# Altium project Weather_Data.PrjPcb (part 2 of 2)

## Sheet Maitinimas board B.SchDoc
size A3; SheetNumber: 3; SheetTotal: 6
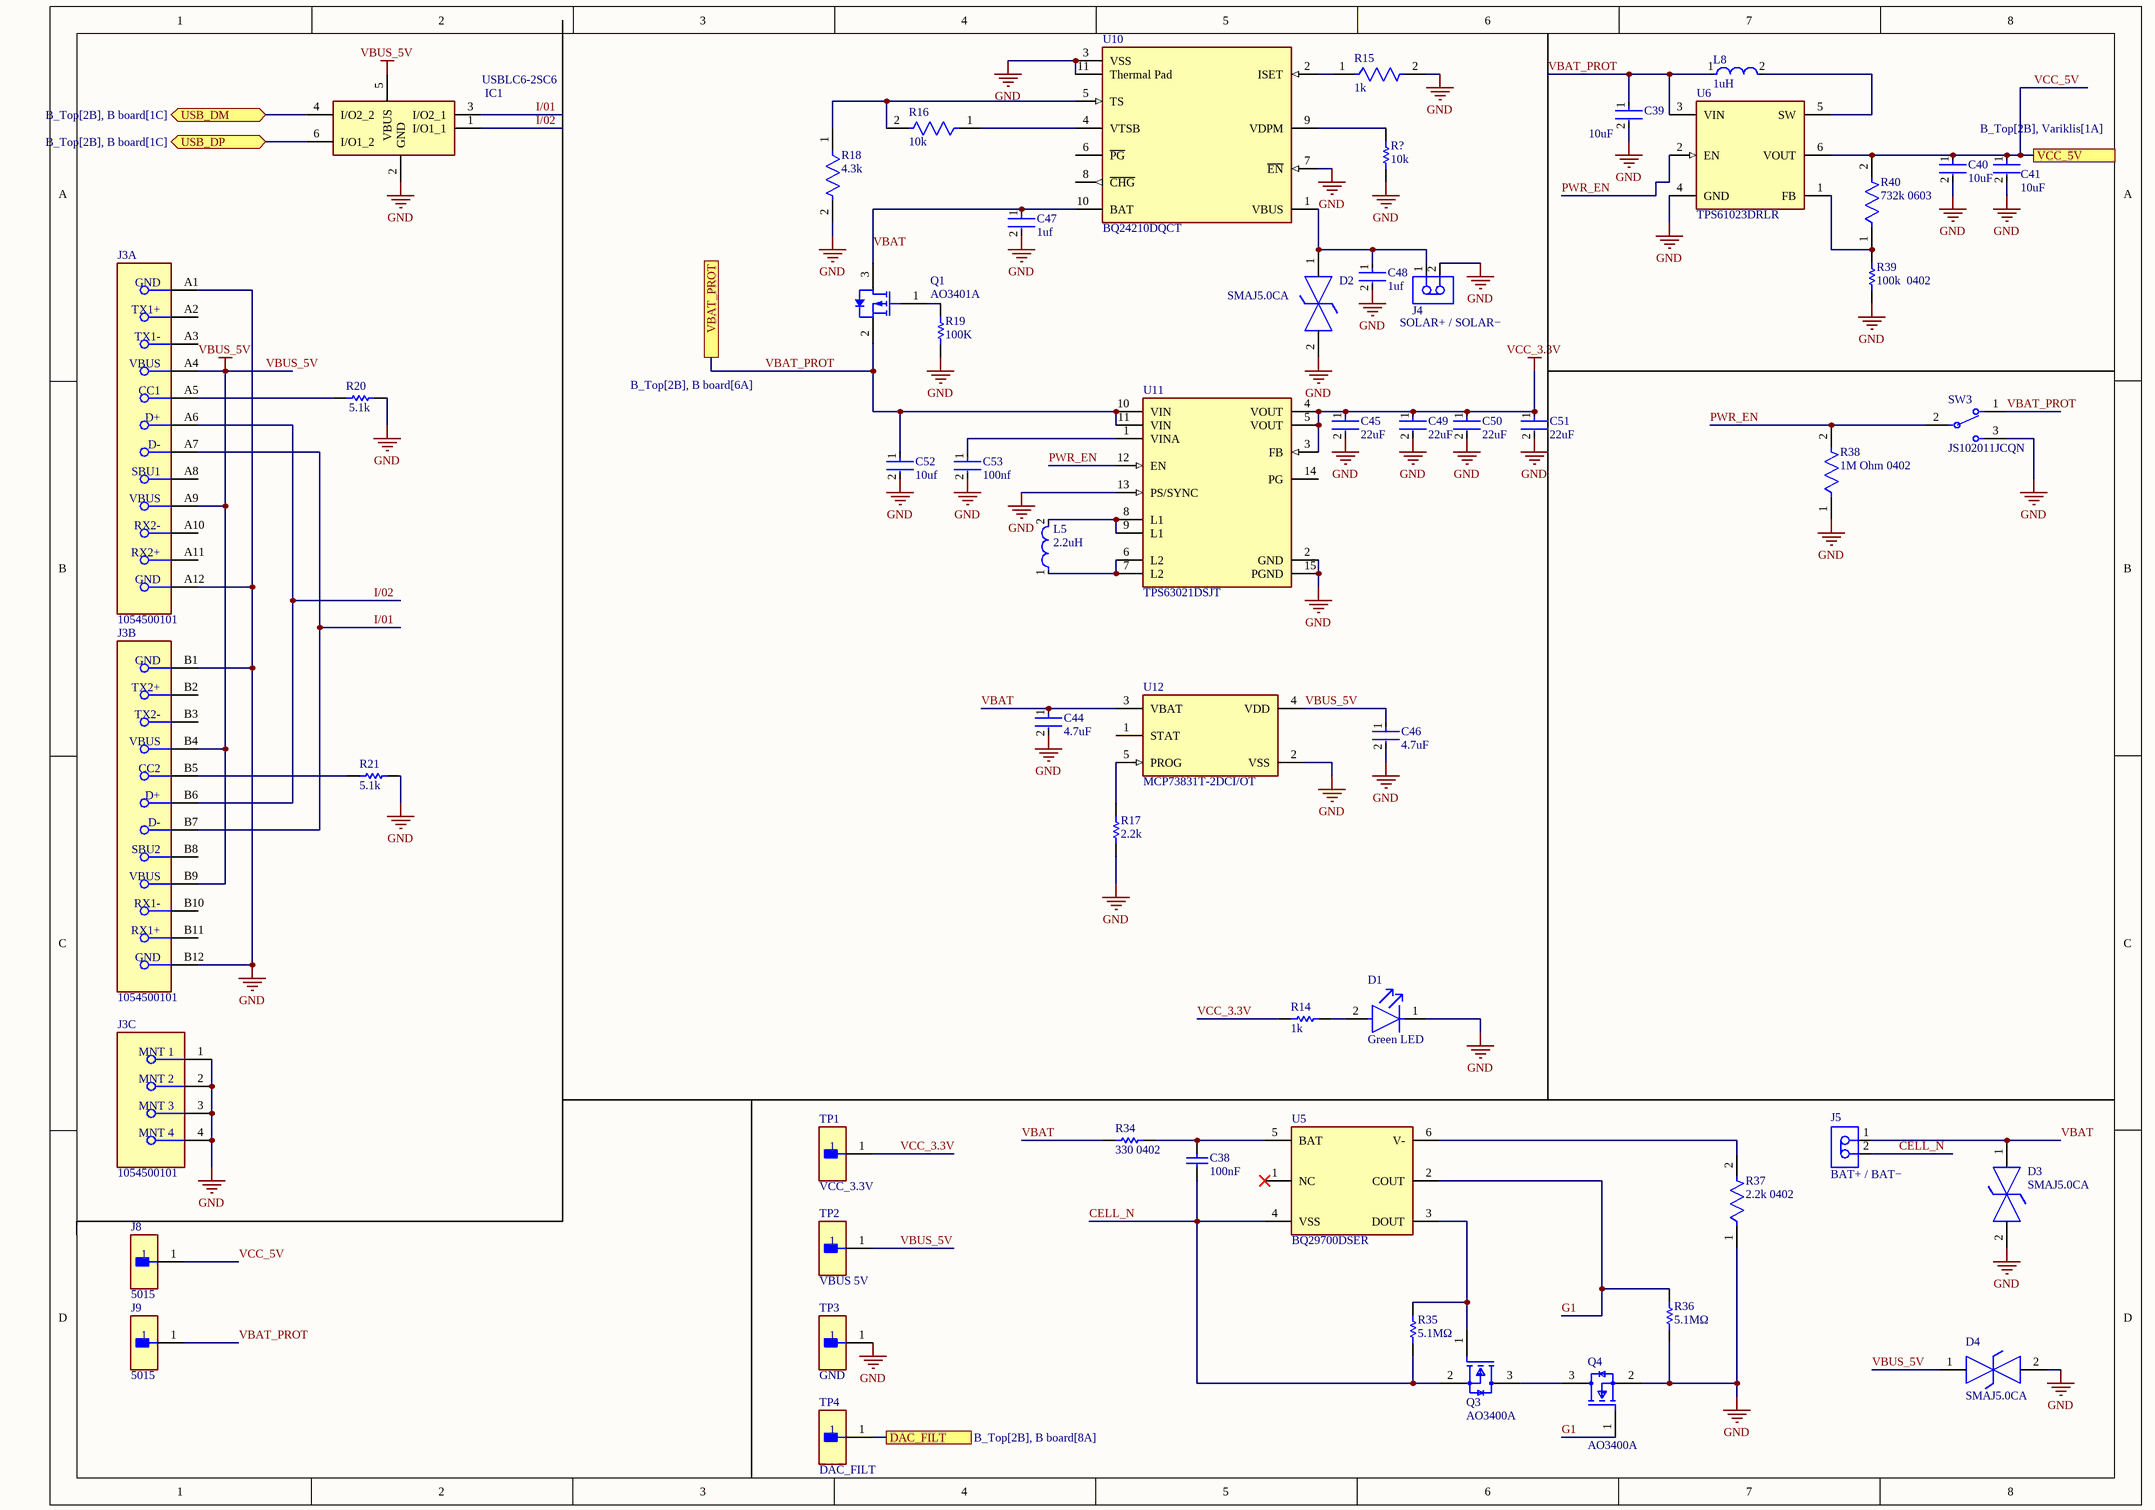
[diagram p2: Maitinimas board B.SchDoc]

### Parts
C38  100nF  [CAPC1608X90X35NL15T15]
C39  10uF  [FP-GRM21B-0_2-e0_2_0_7-IPC_A]
C40  10uF  [FP-GRM21B-0_15-IPC_C]
C41  10uF  [FP-GRM21B-0_15-IPC_C]
C44  4.7uF  [FP-CL21-IPC_A]
C45  22uF  [FP-GRM21B-0_15-IPC_C]
C46  4.7uF  [FP-CL21-IPC_A]
C47  1uf  [FP-CL858-IPC_C]
C48  1uf  [FP-CL858-IPC_C]
C49  22uF  [FP-GRM21B-0_15-IPC_C]
C50  22uF  [FP-GRM21B-0_15-IPC_C]
C51  22uF  [FP-GRM21B-0_15-IPC_C]
C52  10uf  [FP-CL05A106MP5NUNC-MFG]
C53  100nf  [FP-0402B104K500CT-IPC_C]
D1  Green LED  [FP-LTST-C171GKT-MFG]
D2  SMAJ5.0CA  [FP-SMAJ-MFG]
D3  SMAJ5.0CA  [FP-SMAJ-MFG]
D4  SMAJ5.0CA  [FP-SMAJ-MFG]
IC1  USBLC6-2SC6  [SOT95P280X145-6N]
J3  1054500101  [FP-1054500101-MFG]  (parts A,B,C of 3)
J4  SOLAR+ / SOLAR−  [JST-B2B-PH-K-S_V]
J5  BAT+ / BAT−  [JST-B2B-PH-K-S_V]
J8  5015  [FP-5015-MFG]
J9  5015  [FP-5015-MFG]
L5  2.2uH  [FP-MLP2016M-MFG]
L8  1uH  [FP-DFE252012C-IPC_B]
Q1  AO3401A  [AO-SOT-23-3L_V]
Q3  AO3400A  [FP-SOT23-MFG]
Q4  AO3400A  [FP-SOT23-MFG]
R14  1k  [RESC1005X40X25ML10T10]
R15  1k  [FP-TFCR0805-MFG]
R16  10k  [FP-AC0603-IPC_A]
R17  2.2k  [RESC1005X40X25NL10T10]
R18  4.3k  [FP-RN73R1E-MFG]
R19  100K  [RESC1812(4532)_L]
R20  5.1k  [RESC1005X40X25ML10T10]
R21  5.1k  [RESC1005X40X25ML10T10]
R34  330 0402  [RESC1005X40X25NL10T10]
R35  5.1MΩ  [RESC1005X40X25ML05T05]
R36  5.1MΩ  [RESC1005X40X25ML05T05]
R37  2.2k 0402  [FP-ESR01-IPC_B]
R38  1M Ohm 0402  [FP-CRGCQ0402-IPC_C]
R39  100k  0402  [RESC1005X40X25NL05T10]
R40  732k 0603  [FP-CRCW0603-e3-IPC_B]
R?  10k  [RESC3225X60X45NL20T20]
SW3  JS102011JCQN  [FP-JS102011JCQN-MFG]
TP1  VCC_3.3V  [FP-5015-MFG]
TP2  VBUS 5V  [FP-5015-MFG]
TP3  GND  [FP-5015-MFG]
TP4  DAC_FILT  [FP-5015-MFG]
U5  BQ29700DSER  [FP-DSE0006A-IPC_B]
U6  TPS61023DRLR  [FP-DRL0006A-MFG]
U10  BQ24210DQCT  [FP-DQC0010A-MFG]
U11  TPS63021DSJT  [FP-DSJ0014A-MFG]
U12  MCP73831T-2DCI/OT  [FP-C04-091-OT-IPC_B]

### Ports
DAC_FILT (see B_Top[2B], B board[8A]), USB_DM (bidir, see B_Top[2B], B board[1C]), USB_DP (bidir, see B_Top[2B], B board[1C]), VBAT_PROT (see B_Top[2B], B board[6A]), VCC_5V (see B_Top[2B], Variklis[1A])

### Nets
GND: C39.2 C40.2 C41.2 C44.2 C45.2 C46.2 C47.2 C48.2 C49.2 C50.2 C51.2 C52.2 C53.2 D1.1(C) D2.2 D3.2 D4.2 IC1.2(GND) J3.1(MNT_1) J3.2(MNT_2) J3.3(MNT_3) J3.4(MNT_4) J3.A1(GND) J3.A12(GND) J3.B1(GND) J3.B12(GND) J4.2 Q4.2(S) R15.2 R17.1 R18.2 R19.2 R20.2 R21.2 R36.1 R37.1 R38.1 R39.1 R?.1 SW3.3 TP3.1 U6.4(GND) U10.3(VSS) U10.7(~{EN}) U10.11(Thermal_Pad) U11.2(GND) U11.13(PS/SYNC) U11.15(PGND) U12.2(VSS)
VBUS_5V: C46.1 D4.1 IC1.5(VBUS) J3.A4(VBUS) J3.A9(VBUS) J3.B4(VBUS) J3.B9(VBUS) TP2.1 U12.4(VDD)
VCC_3.3V: C45.1 C49.1 C50.1 C51.1 R14.1 TP1.1 U11.3(FB) U11.4(VOUT) U11.5(VOUT)
CELL_N: C38.1 J5.2 Q3.2(S) R35.1 U5.4(VSS)
G1: Q4.1(G) R36.2 U5.2(COUT)
I/01: IC1.3(I/O2_1) J3.A7(D-) J3.B7(D-)
I/02: IC1.1(I/O1_1) J3.A6(D+) J3.B6(D+)
PWR_EN: R38.2 SW3.2 U6.2(EN) U11.12(EN)
VBAT: C44.1 C47.1 D3.1 J5.1 Q1.3(DRAIN) R34.1 U10.10(BAT) U12.3(VBAT)
VBAT_PROT: C39.1 C52.1 J9.1 L8.1 Q1.2(SOURCE) SW3.1 U6.3(VIN) U11.10(VIN) U11.11(VIN) ; port VBAT_PROT
VCC_5V: C40.1 C41.1 J8.1 R40.2 U6.6(VOUT) ; port VCC_5V
NetC17_2: TP4.1 ; port DAC_FILT
NetC38_2: C38.2 R34.2 U5.5(BAT)
NetC48_1: C48.1 D2.1 J4.1 U10.1(VBUS)
NetC53_1: C53.1 U11.1(VINA)
NetD1_2: D1.2(A) R14.2
NetIC1_4: IC1.4(I/O2_2) ; port USB_DM
NetIC1_6: IC1.6(I/O1_2) ; port USB_DP
NetJ3_A5: J3.A5(CC1) R20.1
NetJ3_B5: J3.B5(CC2) R21.1
NetL5_1: L5.1 U11.6(L2) U11.7(L2)
NetL5_2: L5.2 U11.8(L1) U11.9(L1)
NetL8_2: L8.2 U6.5(SW)
NetQ1_1: Q1.1(GATE) R19.1
NetQ3_1: Q3.1(G) R35.2 U5.3(DOUT)
NetQ3_3: Q3.3(D) Q4.3(D)
NetR15_1: R15.1 U10.2(ISET)
NetR16_1: R16.1 U10.4(VTSB)
NetR16_2: R16.2 R18.1 U10.5(TS)
NetR17_2: R17.2 U12.5(PROG)
NetR37_2: R37.2 U5.6(V-)
NetR39_2: R39.2 R40.1 U6.1(FB)
NetR?_2: R?.2 U10.9(VDPM)

Not connected (* = marked no-connect by the designer): J3 A2(TX1+) A3(TX1-) A8(SBU1) A10(RX2-) A11(RX2+) B2(TX2+) B3(TX2-) B8(SBU2) B10(RX1-) B11(RX1+); U5 1(NC)*; U10 6(~{PG}) 8(~{CHG}); U11 14(PG); U12 1(STAT)

### Library data of the parts
C38 = CMP-2006-02299-1: Part Number: C0603C104K4RAC7013; Manufacturer: Kemet
C39 = CMP-06035-026322-1: Chip Multilayer Ceramic Capacitors for General Purpose, 0805, 22uF, X5R, 15%, 20%, 16V; Height: 1.25mm; Thickness: 0.057inch; Min Operating Temperature: -55°C; Tolerance: 20%; Package Quantity: 3000; Packaging: Tape and Reel; Capacitance: 22uF; Case/Package: 0805; Voltage Rating: 16V; Dielectric: X5R; Max Operating Temperature: 85°C; Case Code (Metric): 2012; Depth: 1.25mm; Lead Free: Lead Free; Termination: SMD/SMT; Case Code (Imperial): 0805; Voltage Rating (DC): 16V; Length: 2mm; Weight: 0.000335oz; Width: 0.049inch; Mount: Surface Mount
C40 C41 = CMP-2007-03541-2: Chip Multilayer Ceramic Capacitors for General Purpose, 0805, 10uF, X5R, 15%, 10%, 25V; Length: 2mm; Depth: 1.25mm; Termination: SMD/SMT; Voltage: 25V; Height: 1.25mm; Material: Ceramic; Thickness: 0.053inch; Radiation Hardening: No; Min Operating Temperature: -55°C; Width: 0.049inch; Package Quantity: 1; Mount: Surface Mount; Dielectric: X5R; Packaging: Tape and Reel; Capacitance: 10uF; Voltage Rating (DC): 25V; Lead Free: Lead Free; Max Operating Temperature: 85°C; Case Code (Imperial): 0805; Case/Package: 0805; Tolerance: 10%; Voltage Rating: 25V; Case Code (Metric): 2012
C44 C46 = CMP-13271-002624-1: CL21 Series 0805 4.7uF 25V ±10% Tolerance X5R Multilayer Ceramic Chip Capacitor; Case Code (Imperial): 0805; Thickness: 0.055inch; Mount: Surface Mount; Case Code (Metric): 2012; Capacitance: 4.7uF; Depth: 1.25mm; Lead Free: Lead Free; Case/Package: 0805; Voltage Rating: 25V; Package Quantity: 1; Width: 0.049inch; Radiation Hardening: No; Voltage Rating (DC): 25V; Length: 2mm; Dielectric: X5R; Height: 1.25mm; Packaging: Tape and Reel; Tolerance: 10%; Min Operating Temperature: -55°C; Max Operating Temperature: 85°C
C45 C49-C51 = CMP-06035-052350-1: Chip Multilayer Ceramic Capacitors for General Purpose, 0805, 22uF, X5R, 15%, 20%, 10V; Tolerance: 20%; Capacitance: 22uF; Dielectric: X5R; Width: 1.25mm; Voltage Rating (DC): 10V; Length: 2mm; Thickness: 1.25mm; Case/Package: 0805
C47 C48 = CMP-13271-003231-1: Cap Ceramic 1uF 6.3V X6S ±10% SMD 0402 +105°C Paper T/R; Mount: Surface Mount; Voltage Rating: 6.3V; Min Operating Temperature: -55°C; Case/Package: 0402; Thickness: 0.022inch; Radiation Hardening: No; Capacitance: 1uF; Contact Plating: Tin; Max Operating Temperature: 105°C; Length: 1mm; Tolerance: 10%; Dielectric: X6S; Height: 0.5mm; Depth: 0.5mm; Case Code (Imperial): 0402; Package Quantity: 1; Width: 0.02inch; Case Code (Metric): 1005; Packaging: Tape and Reel
C52 = CMP-13271-000002-1: CAP CER 10UF 10V X5R 0402; Manufacturer Part Number: CL05A106MP5NUNC; Manufacturer: Samsung; Temperature Coefficient: 15%; Tolerance: 20%; Material: Ceramic; Octopart: https://octopart.com/cl05a106mp5nunc-samsung-22457395; Voltage Rating: 10V; RoHS: TRUE; Value: 10uF; Height: 0.7mm; Digikey Description: CAP CER 10UF 10V X5R 0402; Automotive: No; Package: CL05A106MP5NUNC; Device Class L1: Passive Components; Capacitance: 10uF; Temperature Range High: +85°C; ComponentLink2Description: Datasheet; Device Class L2: Capacitors; Temperature Characteristic: X5R; Temperature: -55°C to +85°C; ComponentLink2URL: http://www.samsungsem.com/kr/support/product-search/mlcc/__icsFiles/afieldfile/2019/05/10/19-CL05A106MP5NUNC.pdf; Device Class L3: Ceramic Capacitors; Category: Cap; Temperature Range Low: -55°C; Ipc Land Pattern Name: CAPC10050X50; Lead Free: Yes
C53 = CMP-45632-000010-1: CAP CER 0.1UF 50V X7R 0402; Tolerance: 10%; Max Operating Temperature: 125°C; Case Code (Metric): 1005; RoHS Compliant: Yes; Series: -; Case Code (Imperial): 0402; Voltage Rating: 50V; Min Operating Temperature: -55°C; Mount: Surface Mount; Capacitance: 100nF; Case/Package: 0402; Packaging: Cut Tape
D1 = CMP-22017-000007-1: LED GREEN CLEAR CHIP SMD; Luminous Intensity: 12mcd; Lens Color: Colorless; Dominant Wavelength: 569nm; Number of LEDs: 1; Power Dissipation: 100mW; Viewing Angle: 130°; Reverse Voltage: 5V; Test Current: 10mA; Forward Voltage: 2.1V; Wavelength: 585nm; Lens Style: Diffused; Forward Current: 30mA; Height: 0.8mm; Mount: Surface Mount; Package Quantity: 1; Length: 2mm; Case Code (Metric): 2012; Number of Pins: 2; Number of Elements: 1; Packaging: Tape and Reel; Color: Green; Min Operating Temperature: -55°C; Case/Package: 0805; Power Rating: 100mW; Max Operating Temperature: 85°C; Radiation Hardening: No; Depth: 1.25mm; Lens Transparency: Clear; Width: 1.25mm; Lead Free: Lead Free; Case Code (Imperial): 0805; Illumination Color: Green
D2-D4 = CMP-2000-07091-2: TVS DIODE 5V 9.2V SMA; Manufacturer: Bourns Inc.; Direction: Bidirectional; Standoff Height: 0.05mm; Breakdown Voltage: 6.4V; Number Of Channels: 1; Max Junction Temp: +150°C; Peak Pulse Power: 400W; Lead Free: Yes; Digikey Description: TVS DIODE 5V 9.2V SMA; Automotive: No; Temperature: -55°C to +150°C; Package: SMAJ; Temperature Range Low: -55°C; Octopart: https://octopart.com/smaj5.0ca-bourns-12809390; Device Class L2: TVS Diodes; Device Class L3: unset; ComponentLink2URL: https://bourns.com/data/global/pdfs/SMAJ.pdf; RoHS: TRUE; ComponentLink2Description: Datasheet; Mouser Description: TVS Diodes - Transient Voltage Suppressors 5volts 800/1600uA 43.5 Amps Bi-Dir; Reverse Standoff Voltage: 5V; Temperature Range High: +150°C; Height: 2.62mm; Manufacturer Part Number: SMAJ5.0CA; Category: Diode; Device Class L1: Circuit Protection
IC1 = USBLC6-2SC6: Integrated Circuit; Manufacturer_Name: STMicroelectronics; Datasheet Link: https://www.st.com/resource/en/datasheet/usblc6-2.pdf; Height: 1.45mm; Manufacturer_Part_Number: USBLC6-2SC6; Mouser Part Number: 511-USBLC6-2SC6; Mouser Price/Stock: https://www.mouser.co.uk/ProductDetail/STMicroelectronics/USBLC6-2SC6?qs=po45yt2pPpu%2FhNIlwQdTlg%3D%3D; Arrow Part Number: USBLC6-2SC6; Arrow Price/Stock: https://www.arrow.com/en/products/usblc6-2sc6/stmicroelectronics.html?utm_currency=USD&region=asia
J3 = CMP-04767-000004-1: CONN RCP USB3.1 TYPEC 24P SMD RA; Manufacturer: Molex; Number Of Contacts: 24; Voltage Rating: 30V; Shielding: true; Is Female: yes; Current Rating: 0.25/1.25/5A; Pitch: 0.5mm; Conn Orientation: Right Angle; Package: 0; Height: 3.44mm; Footprint Url: https://www.molex.com/pdm_docs/sd/1054500101_sd.pdf; Device Class L1: Connectors; Category: Conn; Device Class L2: USB Connectors; Digikey Description: CONN RCP USB3.1 TYPEC 24P SMD RA; Contact Material: Gold,Nickel; Mouser Description: USB Shielded I/O Receptacle; Type C; Right Angle; Surface Mount; Gold over Nickel; ComponentLink2Description: Datasheet; Lead Free: Yes; Automotive: No; Temperature Range High: +85°C; RoHS: TRUE; Octopart: https://octopart.com/105450-0101-molex-68082325; ComponentLink2URL: https://www.molex.com/webdocs/datasheets/pdf/en-us/1054500101_IO_CONNECTORS.pdf; Temperature: -30°C to +85°C; Usb Standard: USB 3.1; Temperature Range Low: -30°C; Device Class L3: unset; Manufacturer Part Number: 1054500101
J4 J5 = CMP-2000-05162-1: Male Header, Pitch 2 mm, 1 x 2 Position, Height 6 mm, Tail Length 3.4 mm, -25 to 85 degC, RoHS, Bulk; Manufacturer: JST; Pitch: 2mm; Style/Orientation: StraightHeader/Plug; No of Positions: 2; Datasheet Version: Nov-08; Datasheet URL: http://datasheet.octopart.com/B2B-PH-K-S%28LF%29%28SN%29-JST-datasheet-8324864.pdf; Manufacturer URL: http://www.jst.com/home2.html; Type: ShroudedHeader; Termination: Crimp
J8 J9 = CMP-2000-05183-2: PC TEST POINT MINIATURE; Manufacturer: keystone; Number Of Contacts: 1; Conn Orientation: Straight; Category: Conn; Manufacturer Part Number: 5015; Digikey Description: PC TEST POINT MINIATURE; Automotive: No; Lead Free: Yes; Octopart: https://octopart.com/5015-keystone-3822; ComponentLink2URL: http://www.keyelco.com/product-pdf.cfm?p=1353; Package: 5015; RoHS: TRUE; Device Class L3: unset; Device Class L2: unset; Contact Material: Silver; Device Class L1: Connectors; Height: 1.65mm; ComponentLink2Description: Datasheet
L5 = CMP-08253-000274-1: Shielded Multilayer Inductor 2.2uH ±20% 1200mA 137.5mΩ SMD 0806; DC Resistance (DCR): 137.5mR; Current Rating: 1.2A; Test Frequency: 2MHz; Core Material: Ferrite; Shielding: Unshielded; Mount: Surface Mount; Max Operating Temperature: 125°C; Packaging: Tape and Reel; Lead Free: Lead Free; Height - Seated (Max): 0.039inch; Length: 0.079inch; Case/Package: 0806; Case Code (Metric): 2016; Case Code (Imperial): 0806; Inductance: 2.2uH; RoHS Compliant: Yes; Width: 0.063inch; Package Quantity: 3000; Tolerance: 20%; Min Operating Temperature: -40°C
L8 = CMP-06042-006150-1: Shielded Wirewound Inductor 1uH 20% 3200mA 0.042Ω 1008 (2520); Core Material: Ferrite; Current Rating: 4.3A; Test Frequency: 1MHz; DC Resistance (DCR): 42mR; Max DC Current: 3.2A; Tolerance: 20%; Resistor Type: Wirewound; Inductance: 1uH; Length: 0.098inch; Min Operating Temperature: -40°C; Case Code (Imperial): 1008; Mount: Surface Mount; Depth: 2mm; Height - Seated (Max): 0.039inch; Max Operating Temperature: 125°C; Width: 0.079inch; Case/Package: 1008; Packaging: Tape and Reel; Case Code (Metric): 2520; Shielding: Shielded
Q1 = CMP-2000-05778-1: P-Channel MOSFET, 30 V, 4 A, -55 to 150 degC, 3-Pin SOT-23-3L, RoHS, Tape and Reel; Manufacturer: Alpha and Omega; Output Power (Max): NotRequiredW; Power Dissipation: 1.4W; Rad Hardened: No; Drain Efficiency: NotRequired%; Drain-Source On-Volt: 30V; Noise Figure: NotRequireddB; Frequency (Max): NotRequiredMHz; Number of  Elements: 1; Gate-Source Voltage (Max): ?12V; Drain Current (Max): 4A; Channel Mode: Enhancement; Drain-Source On-Res: 0.044ohm; Type: PowerMOSFET; Polarity: P; Package URL: http://www.aosmd.com/res/packaging_information/SOT-23-3L.pdf; Datasheet URL: http://www.aosmd.com/res/data_sheets/AO3401A.pdf; Package Type: SOT-23; Package Description: 3-Pin Small Outline Transistor, Body 2.95 x 1.6 mm, Pitch 0.95 mm; Mounting: SurfaceMount; Manufacturer URL: http://www.aosmd.com/; Continuous Drain Current: 4A; Package Reference: SOT-23-3L; Mounting Technology: SurfaceMount; Operating Temperature Classification: Military; Power Gain: NotRequireddB; Datasheet Version: Rev. 3, 03/2011; Operating Temp Range: -55Cto150C; Pin Count: 3
Q3 Q4 = CMP-83955-000006-1: MOSFET N-CH 30V 5.7A SOT23; Input Capacitance: 630pF; Number of Elements: 1; Rds On Max: 26.5mR; Max Power Dissipation: 1.4W; Gate to Source Voltage (Vgs): 12V; Min Operating Temperature: -55°C; Lead Free: Lead Free; Number of Pins: 3; Drain to Source Voltage (Vdss): 30V; Case/Package: SOT-23; Mount: Surface Mount; Continuous Drain Current (ID): 5.7A; Radiation Hardening: No; Packaging: Tape and Reel; Max Operating Temperature: 150°C; Power Dissipation: 1.4W
R14 = CMP-2002-04581-1: Manufacturer: KOA Speer; Part Number: SG73P1ETTP1001F
R15 = CMP-250906-230108-1: RES Thin Film,  620Ω, 0.1%, 0.125W, 50ppm/°C, 0805
R16 = CMP-03412-040683-1: RES 10kΩ 5.00% 0.2W 0603
R17 = CMP-2002-03812-1: Manufacturer: KOA Speer; Part Number: RK73H1ETTP2201F
R18 = CMP-04015-046329-1: 4.3kΩ ±1% 0.063W, 1/16W Chip Resistor 0402 (1005 Metric) Moisture Resistant Thin Film
R19 = CMP-1016-00715-1: 100K 0.75W 1% 1812 (4532 Metric)  SMD; Case-EIA: 1812; Value: 100000.00 Ohm; Case-Metric: 4532; Technology: SMT; Power: 0.75 W; Tolerance: 1 %
R20 R21 = CMP-2002-04046-1: Manufacturer: KOA Speer; Part Number: RK73H1ETTP5101F
R34 = CMP-1011-00454-2: Part Number: CR0402-FX-3300GLF; Manufacturer: Bourns
R35 R36 = CMP-1011-00163-2: Part Number: ERJ-2GEJ515X; Manufacturer: Panasonic
R37 = CMP-08839-005908-1: 2.2kΩ ±1% 0.2W 0402 Anti-Surge Chip Resistor AEC-Q200; RoHS Compliant: Yes
R38 = CMP-03211-005885-1: Res Thick Film 0402 1M Ohm 1% 0.063W(1/16W) ±100ppm/C Pad SMD Automotive T/R; Manufacturer: TE Connectivity; Manufacturer Part Number: CRGCQ0402F1M0; Power Rating: 0.0625W; Tolerance: 0.01; Resistance: 1MΩ; Voltage Rating: 50V; Value: 1MΩ; Temperature Coefficient: ±100ppm/°C; Series: CRGCQ; Digikey Description: Res Thick Film 0402 1M Ohm 1% 0.063W(1/16W) ±100ppm/C Pad SMD Automotive T/R; Automotive: Yes; ComponentLink2URL: https://www.te.com/commerce/DocumentDelivery/DDEController?Action=showdoc&DocId=Data+Sheet%7F1773204-3%7F1%7Fpdf%7FEnglish%7FENG_DS_1773204-3_1.pdf%7F4-2176347-1378; Ipc Land Pattern Name: RESC10050X35; Category: Res; ComponentLink2Description: Datasheet; Temperature Range High: +155°C; Temperature Range Low: -55°C; Device Class L3: Chip SMD Resistors; RoHS: TRUE; Lead Free: Yes; Octopart: https://octopart.com/crgcq0402f1m0-te+connectivity-91017950; Ambient Temperature Range High: +70°C; Package: CRGCQ0402; Mouser Description: Res Thick Film 0402 1M Ohm 1% 0.063W(1/16W) ±100ppm/C Pad SMD Automotive T/R; Device Class L1: Passive Components; Temperature: -55°C to +155°C; Composition: Thick Film; Device Class L2: Resistors; Height: 0.4mm
R39 = CMP-2002-07343-1: Part Number: RC0402FR-07100KL; Manufacturer: Yageo / Phycomp
R40 = CMP-1012-00834-2: RES Thick Film, 732kΩ, 1%, 0.1W, 100ppm/°C, 0603; Power Rating: 100mW; Resistance: 732kR; Voltage Rating: 75V; Number of Terminations: 2; Temperature Coefficient: 100ppm/°C; Tolerance: 1%; Package Quantity: 10; Case/Package: 0603; Max Power Dissipation: 100mW; Features: Automotive AEC-Q200; Height: 0.02inch; Military Standard: Not; Contact Plating: Tin; Radiation Hardening: No; Case Code (Imperial): 0603; Depth: 0.85mm; Number of Pins: 2; Min Operating Temperature: -55°C; Width: 0.033inch; Weight: 7.1E-05oz; Composition: Thick Film; Packaging: Tape and Reel; Length: 1.55mm; Termination: SMD/SMT; Case Code (Metric): 1608; Max Operating Temperature: 155°C
R? = CMP-2005-01993-1: Part Number: CRCW121010K0FKEA; Manufacturer: Vishay Dale
SW3 = CMP-10038-000010-1: SWITCH SLIDE SPDT 300MA 6V; Electrical Life: 5000Cycles; Switch Function: On-On; Actuator Material: Nylon; Actuator Length: 2mm; Actuator Type: Standard; Current Rating: 300mA; Voltage Rating (DC): 6V; Min Operating Temperature: -40°C; Throw Configuration: SPDT; Mount: Surface Mount; Switch Travel: 2mm; Max Operating Temperature: 85°C; Packaging: Cut Tape; Contact Plating: Silver; Contact Material: Copper Alloy
TP1-TP4 = CMP-2000-05183-2: PC TEST POINT MINIATURE; Manufacturer Part Number: 5015; Manufacturer: keystone; Number Of Contacts: 1; Conn Orientation: Straight; Category: Conn; Digikey Description: PC TEST POINT MINIATURE; Automotive: No; Lead Free: Yes; Octopart: https://octopart.com/5015-keystone-3822; ComponentLink2URL: http://www.keyelco.com/product-pdf.cfm?p=1353; Package: 5015; RoHS: TRUE; Device Class L3: unset; Device Class L2: unset; Contact Material: Silver; Device Class L1: Connectors; Height: 1.65mm; ComponentLink2Description: Datasheet
U5 = CMP-04911-000043-1: IC LITHIUM BATT PROTECT 6-SON; Number of Cells: 1; Fault Protection: Over Current; Operating Supply Voltage: 8V; Packaging: Tape and Reel; RoHS Compliant: Yes; Contact Plating: Gold; Lead Free: Lead Free; Min Operating Temperature: -40°C; Number of Pins: 6; Max Operating Temperature: 85°C; Package Quantity: 3000; Mount: Surface Mount; Weight: 0.000342oz
U6 = CMP-04918-000638-1: FINISH GOODS FOR TPS61023
U10 = CMP-0321-00481-3: IC BATT CHARGER LI-ION 10WSON; Battery Type: LITHIUM-ION; Max Output Current: 1.25A; Max Charge Current: 800mA; Output Voltage: 4.2V; Min Supply Voltage: 4V; Min Input Voltage: 3.5V; Max Supply Voltage: 6.5V; Number of Cells: 1; Length: 3.1mm; Case/Package: SON; Height: 0.75mm; Max Operating Temperature: 85°C; Contact Plating: Gold; Package Quantity: 1; RoHS Compliant: Yes; Radiation Hardening: No; Number of Pins: 10; Min Operating Temperature: -40°C; Width: 2.1mm; REACH SVHC: No SVHC; Series: -; Packaging: Tape and Reel; Operating Supply Current: 800mA; Lead Free: Lead Free; Output Current: 800mA
U11 = CMP-04918-000699-1: IC REG BCK BST 3.3V 3.5A 14VSON; Output Type: Fixed; Output Current: 3A; Switching Frequency: 2.4MHz; Operating Supply Voltage: 5.5V; Supply Current: 50uA; Number of Outputs: 1; Topology: Buck-Boost; Efficiency: 96%; Output Configuration: Positive; Min Input Voltage: 1.8V; Synchronous Rectifier: Yes; Output Voltage: 3.3V; Package Quantity: 250; Case/Package: VSON; Max Input Voltage: 5.5V; Quiescent Current: 50uA; Nominal Supply Current: 50uA; Min Output Voltage: 3.3V; Number of Pins: 14; Lead Free: Lead Free; Max Operating Temperature: 85°C; Mount: Surface Mount; Max Output Current: 3A; Radiation Hardening: No; Series: -; Min Operating Temperature: -40°C; Packaging: Tape and Reel; RoHS Compliant: Yes; Min Supply Voltage: 1.8V
U12 = CMP-0133-00146-2: IC CONTROLLR LI-ION 4.2V SOT23-5; Max Charge Current: 500mA; Min Output Voltage: 4.168V; Max Supply Voltage: 6V; Max Output Voltage: 4.232V; Number of Cells: 1; Operating Supply Current: 510uA; Min Supply Voltage: 3.75V; Max Output Current: 500mA; Case/Package: SOT-23; Radiation Hardening: No; REACH SVHC: No SVHC; Package Quantity: 3000; Output Current: 500mA; Number of Channels: 1; Output Voltage: 4.2V; Max Operating Temperature: 85°C; Number of Pins: 5; Mount: Surface Mount; Length: 3.1mm; Contact Plating: Tin; Packaging: Tape and Reel; Width: 1.8mm; Min Operating Temperature: -40°C; Max Input Voltage: 3.75V; Height: 1.3mm; Lead Free: Lead Free

## Sheet Komunikacija.SchDoc
size A3; SheetNumber: 6; SheetTotal: 6
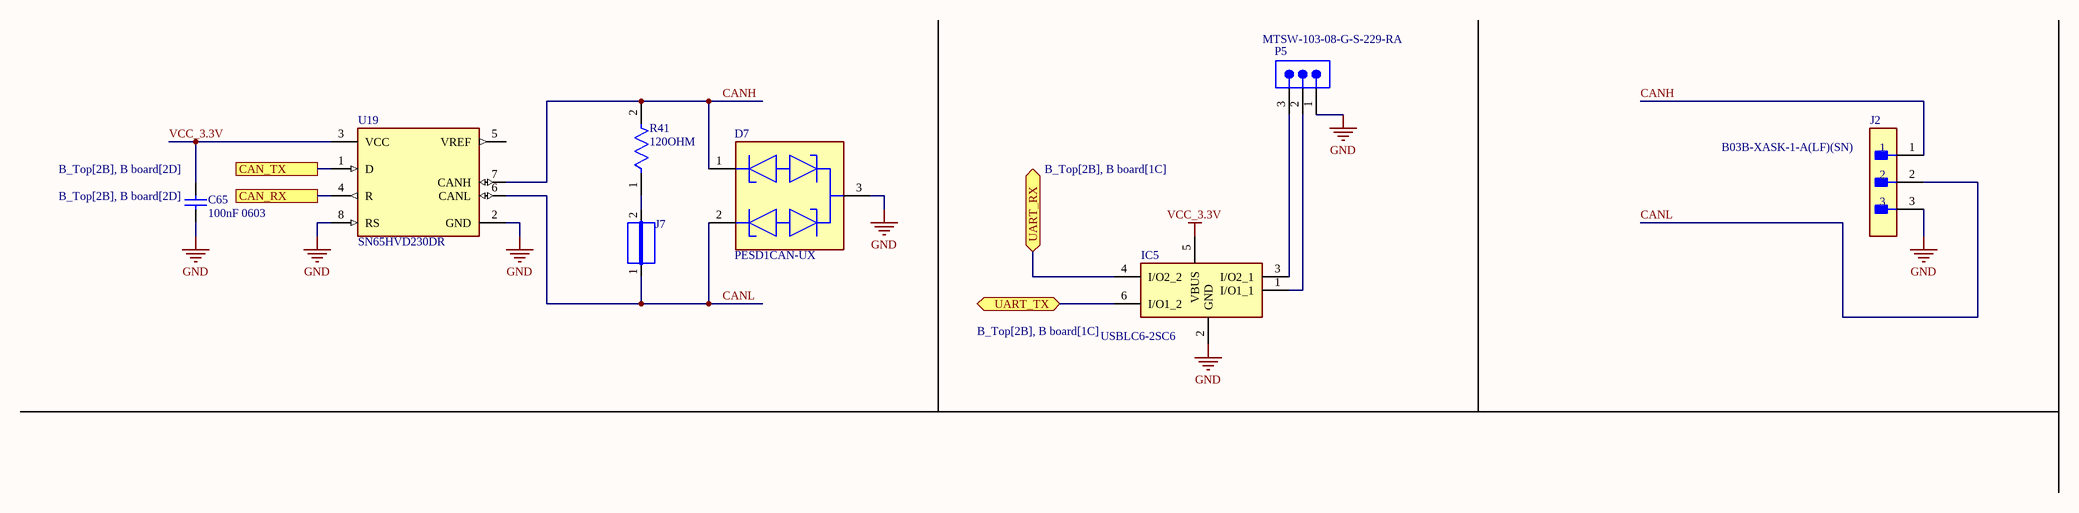
[diagram p3: Komunikacija.SchDoc]

### Parts
C65  100nF 0603  [CAPC1608X90X35NL15T15]
D7  PESD1CAN-UX  [FP-SOT323-MFG]
IC5  USBLC6-2SC6  [SOT95P280X145-6N]
J2  B03B-XASK-1-A(LF)(SN)  [FP-B03B-XASK-1-A_LF_SN-MFG]
J7  JUMPER  [JUMPER]  (value not drawn)
P5  MTSW-103-08-G-S-229-RA  [SMTC-MTSW-103-08-X-S-229-RA]
R41  120OHM  [FP-RMCF0201-IPC_B]
U19  SN65HVD230DR  [FP-D0008A-IPC_A]

### Ports
CAN_RX (see B_Top[2B], B board[2D]), CAN_TX (see B_Top[2B], B board[2D]), UART_RX (bidir, see B_Top[2B], B board[1C]), UART_TX (bidir, see B_Top[2B], B board[1C])

### Nets
GND: C65.1 D7.3(common_cathode) IC5.2(GND) J2.3 P5.1 U19.2(GND) U19.8(RS)
VCC_3.3V: C65.2 IC5.5(VBUS) U19.3(VCC)
CANH: D7.1(cathode_1) J2.1 R41.2 U19.7(CANH)
CANL: D7.2(cathode_2) J2.2 J7.1 U19.6(CANL)
NetIC5_1: IC5.1(I/O1_1) P5.2
NetIC5_3: IC5.3(I/O2_1) P5.3
NetIC5_4: IC5.4(I/O2_2) ; port UART_RX
NetIC5_6: IC5.6(I/O1_2) ; port UART_TX
NetJ7_2: J7.2 R41.1
NetU4_35: U19.1(D) ; port CAN_TX
NetU4_58: U19.4(R) ; port CAN_RX

Not connected (* = marked no-connect by the designer): U19 5(VREF)

### Library data of the parts
C65 = CMP-2006-02299-1: as C38 on sheet Maitinimas board B
D7 = CMP-14436-000006-1: TVS DIODE 24V 50V SC70-3
IC5 = USBLC6-2SC6: as IC1 on sheet Maitinimas board B; Datasheet Link: https://www.st.com/resource/en/datasheet/usblc6-2.pdf; Height: 1.45mm; Manufacturer_Part_Number: USBLC6-2SC6; Mouser Part Number: 511-USBLC6-2SC6; Mouser Price/Stock: https://www.mouser.co.uk/ProductDetail/STMicroelectronics/USBLC6-2SC6?qs=po45yt2pPpu%2FhNIlwQdTlg%3D%3D; Arrow Part Number: USBLC6-2SC6; Arrow Price/Stock: https://www.arrow.com/en/products/usblc6-2sc6/stmicroelectronics.html?utm_currency=USD&region=asia
J2 = CMP-17439-000540-1: CONN HEADER VERT 3POS 2.5MM; Number of Positions: 3; Voltage Rating: 250V; Mated Stacking Heights: 11.3mm; Contact Shape: Circular; Pitch: 2.5mm; Lead Free: Lead Free; Connector Type: Header; Flammability Rating: UL94 V-0; Contact Material: Copper Alloy; Packaging: Bulk; Insulation Color: Natural; Fastening Type: Ramp; Contact Type: Male Pin; Series: XA; Termination: Press-Fit; Contact Finish - Mating: TIN; Insulation Material: Nylon; Number of Rows: 1; Mount: Through Hole
J7 = CMP-009-00061-2: Pins: 2
P5 = CMP-1024-00100-1: Modified .025" SQ Post Header, Through-hole, Right Angle, -55 to 125 degC, 2.54 mm Pitch, 3-Pin, Male, RoHS; Manufacturer: Samtec; Pitch: 2.54 mm; ComponentLink1URL: http://www.samtec.com; ComponentLink3Description: Package Specification; Mounting Technology: Through-hole; PackageDescription: Assembly .025" [.64] SQ Post Terminal Strip; ComponentLink2URL: http://www.samtec.com/documents/webfiles/pdf/MTSW.PDF; PackageVersion: BI, 2/1987; ComponentLink1Description: Manufacturer URL; PackageReference: MTSW-103-08-X-S-229-RA; Orientation: Right Angle; DatasheetVersion: F-214; PartNumber: MTSW-103-08-G-S-229-RA; RoHS: True; Temperature Range: -55 to 125 degC; ComponentLink3URL: http://www.samtec.com/documents/webfiles/cpdf/MTSW-XXX-XX-X-X-XXXX-XX-XXX-MKT1.pdf; ComponentLink2Description: Datasheet
R41 = CMP-26527-005399-1: 120Ω ±5% 0.05W 0201 Thick Film Chip Resistor AEC-Q200 compliant; Resistance: 120R; Temperature Coefficient: 200ppm/°C; Max Power Dissipation: 50mW; Number of Terminations: 2; Mount: Surface Mount; Resistor Type: Thick Film; RoHS Compliant: Yes; Case/Package: 0201; Width: 0.012inch; Max Operating Temperature: 125°C; Tolerance: 5%; Radiation Hardening: No; Case Code (Metric): 0603; Min Operating Temperature: -55°C; Height: 0.009inch; Length: 0.024inch; Contact Plating: Tin; Case Code (Imperial): 0201; Packaging: Tape and Reel
U19 = CMP-0315-00015-3: IC TRANSCEIVER HALF 1/1 8SOIC; Number of Transceivers: 1; Operating Supply Voltage: 3.3V; Number of I/Os: 2; Max Supply Current: 17mA; Max Supply Voltage: 3.6V; Min Supply Voltage: 3V; Data Rate: 1Mbps; Min Operating Temperature: -40°C; Packaging: Tape and Reel; Lead Free: Lead Free; Number of Transmit Buffers: 1; Max Operating Temperature: 85°C; Number of Receive Buffers: 1; Number of Pins: 8; Package Quantity: 1; Radiation Hardening: No; Case/Package: D; REACH SVHC: No SVHC; Weight: 0.002561oz; Termination: SMD/SMT; Contact Plating: Gold; Nominal Supply Current: 17mA; Number of Receivers: 1; Number of Drivers: 1

## Sheet Sensors.SchDoc
size A3; SheetNumber: 4; SheetTotal: 6
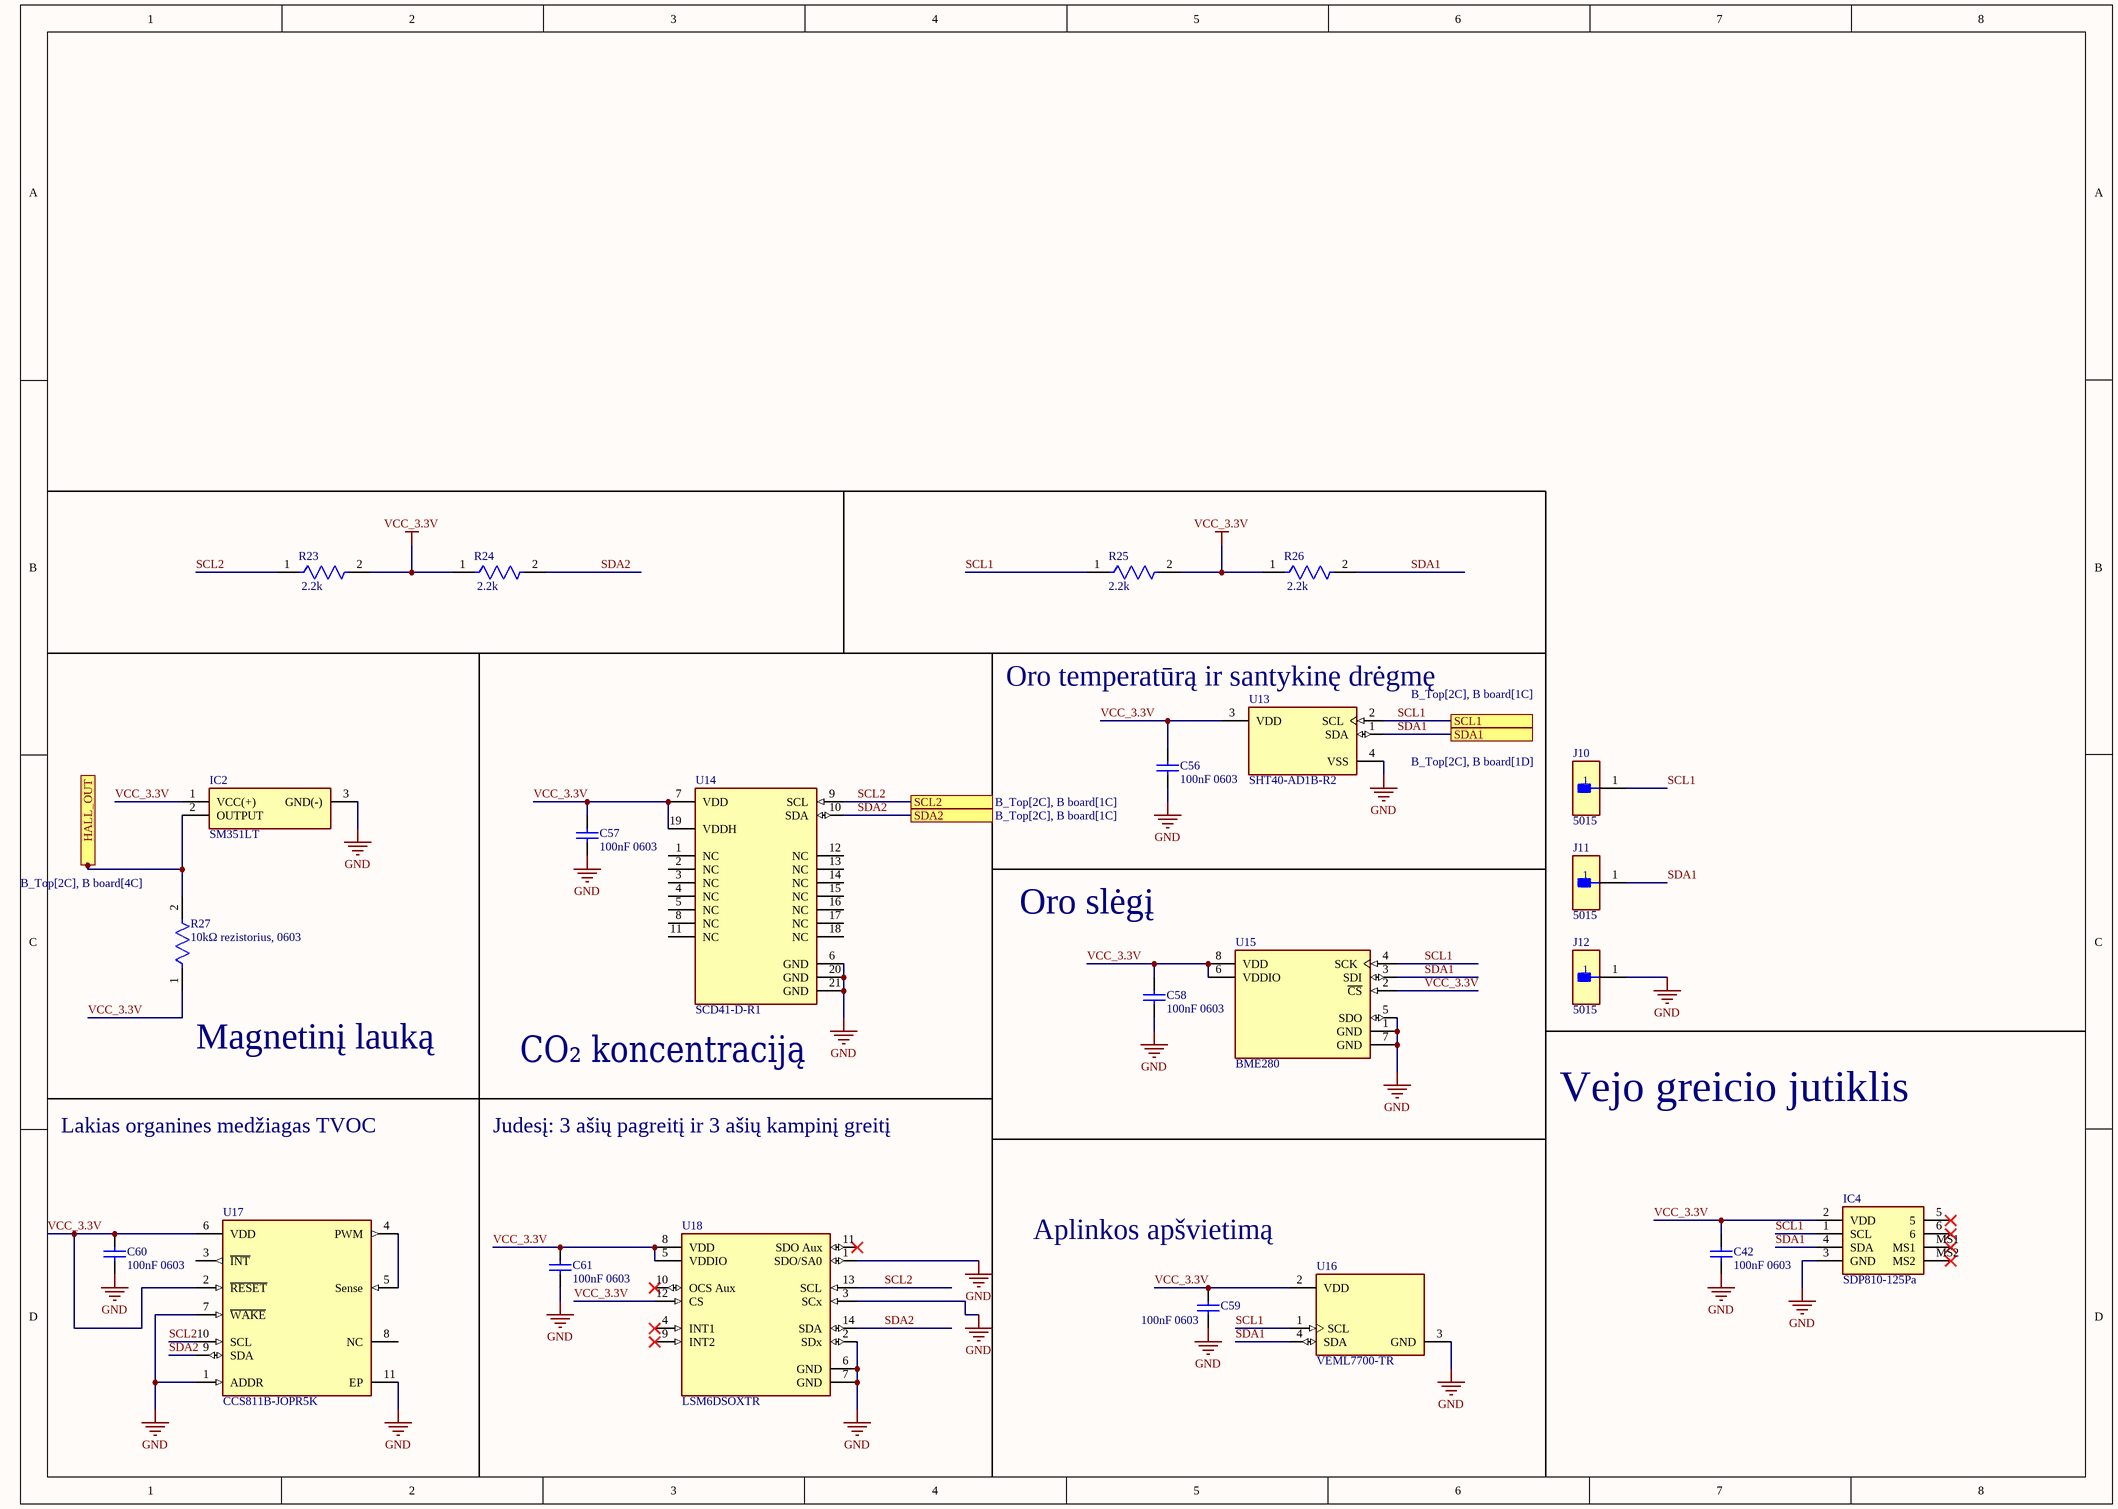
[diagram p4: Sensors.SchDoc]

### Parts
C42  100nF 0603  [CAPC1608X90X35NL15T15]
C56  100nF 0603  [CAPC1608X90X35NL15T15]
C57  100nF 0603  [CAPC1608X90X35NL15T15]
C58  100nF 0603  [CAPC1608X90X35NL15T15]
C59  100nF 0603  [CAPC1608X90X35NL15T15]
C60  100nF 0603  [CAPC1608X90X35NL15T15]
C61  100nF 0603  [CAPC1608X90X35NL15T15]
IC2  SM351LT  [SOT95P280X140-3N]
IC4  SDP810-125Pa  [SDP810125Pa]
J10  5015  [FP-5015-MFG]
J11  5015  [FP-5015-MFG]
J12  5015  [FP-5015-MFG]
R23  2.2k  [FP-RMCF0603-IPC_C]
R24  2.2k  [FP-RMCF0603-IPC_C]
R25  2.2k  [FP-RMCF0603-IPC_C]
R26  2.2k  [FP-RMCF0603-IPC_C]
R27  10kΩ rezistorius, 0603  [FP-AC0603-MFG]
U13  SHT40-AD1B-R2  [FP-SHT40-AD1B-R2-MFG]
U14  SCD41-D-R1  [FP-SCD41-D-R1-MFG]
U15  BME280  [FP-BME280-MFG]
U16  VEML7700-TR  [FP-6_550-5300_02-4-MFG]
U17  CCS811B-JOPR5K  [FP-CCS811B-JOPR5K-MFG]
U18  LSM6DSOXTR  [FP-LGA-14L-DM00249496-MFG]

### Ports
HALL_OUT (see B_Top[2C], B board[4C]), SCL1 (see B_Top[2C], B board[1C]), SCL2 (see B_Top[2C], B board[1C]), SDA1 (see B_Top[2C], B board[1D]), SDA2 (see B_Top[2C], B board[1C])

### Nets
GND: C42.1 C56.1 C57.1 C58.1 C59.1 C60.1 C61.1 IC2.3(GND(-)) IC4.3(GND) J12.1 U13.4(VSS) U14.6(GND) U14.20(GND) U14.21(GND) U15.1(GND) U15.5(SDO) U15.7(GND) U16.3(GND) U17.1(ADDR) U17.7(~{WAKE}) U17.11(EP) U18.1(SDO/SA0) U18.2(SDx) U18.3(SCx) U18.6(GND) U18.7(GND)
VCC_3.3V: C42.2 C56.2 C57.2 C58.2 C59.2 C60.2 C61.2 IC2.1(VCC(+)) IC4.2(VDD) R23.2 R24.1 R25.2 R26.1 R27.1 U13.3(VDD) U14.7(VDD) U14.19(VDDH) U15.2(~{CS}) U15.6(VDDIO) U15.8(VDD) U16.2(VDD) U17.2(~{RESET}) U17.6(VDD) U18.5(VDDIO) U18.8(VDD) U18.12(CS)
SCL1: IC4.1(SCL) J10.1 R25.1 U13.2(SCL) U15.4(SCK) U16.1(SCL) ; port SCL1
SCL2: R23.1 U14.9(SCL) U17.10(SCL) U18.13(SCL) ; port SCL2
SDA1: IC4.4(SDA) J11.1 R26.2 U13.1(SDA) U15.3(SDI) U16.4(SDA) ; port SDA1
SDA2: R24.2 U14.10(SDA) U17.9(SDA) U18.14(SDA) ; port SDA2
NetIC2_2: IC2.2(OUTPUT) R27.2 ; port HALL_OUT
NetU17_4: U17.4(PWM) U17.5(Sense)

Not connected (* = marked no-connect by the designer): IC4 5* 6* MS1* MS2*; U14 1(NC) 2(NC) 3(NC) 4(NC) 5(NC) 8(NC) 11(NC) 12(NC) 13(NC) 14(NC) 15(NC) 16(NC) 17(NC) 18(NC); U17 3(~{INT}) 8(NC); U18 4(INT1)* 9(INT2)* 10(OCS_Aux)* 11(SDO_Aux)*

### Notes on the sheet
- (near U13) Oro temperatūrą ir santykinę drėgmę
- Oro slėgį
- Magnetinį lauką
- (near U14) CO₂ koncentraciją
- Vejo greicio jutiklis
- Lakias organines medžiagas TVOC
- Judesį: 3 ašių pagreitį ir 3 ašių kampinį greitį
- Aplinkos apšvietimą

### Library data of the parts
C42 C56-C61 = CMP-2006-02299-1: as C38 on sheet Maitinimas board B
IC2 = SM351LT: Integrated Circuit; Manufacturer_Name: Honeywell; Datasheet Link: https://sensing.honeywell.com/honeywell-sensing-nanopower-series-datasheet-50095501-c-en.pdf; Height: 1.4mm; Manufacturer_Part_Number: SM351LT; Mouser Part Number: 785-SM351LT; Mouser Price/Stock: https://www.mouser.co.uk/ProductDetail/Honeywell/SM351LT?qs=sJdZgDoFdSUOIFPguWQjqw%3D%3D; Arrow Part Number: SM351LT; Arrow Price/Stock: https://www.arrow.com/en/products/sm351lt/honeywell?utm_currency=USD&region=europe
IC4 = SDP810-125Pa: Integrated Circuit; Manufacturer_Name: Sensirion; Datasheet Link: https://www.mouser.kr/datasheet/2/682/seri_s_a0008130567_1-2291061.pdf; Height: 24mm; Manufacturer_Part_Number: SDP810-125Pa; Mouser Part Number: 403-SDP810-125PA; Mouser Price/Stock: https://www.mouser.co.uk/ProductDetail/Sensirion/SDP810-125PA?qs=KwaGCOX4wIaNl5Uit0G7rw%3D%3D; Arrow Part Number: SDP810-125PA; Arrow Price/Stock: https://www.arrow.com/en/products/sdp810-125pa/sensirion-ag?region=europe
J10-J12 = CMP-2000-05183-2: as J8 on sheet Maitinimas board B; Category: Conn; Manufacturer Part Number: 5015; Digikey Description: PC TEST POINT MINIATURE; Automotive: No; Lead Free: Yes; Octopart: https://octopart.com/5015-keystone-3822; ComponentLink2URL: http://www.keyelco.com/product-pdf.cfm?p=1353; Package: 5015; RoHS: TRUE; Device Class L3: unset; Device Class L2: unset; Contact Material: Silver; Device Class L1: Connectors; Height: 1.65mm; ComponentLink2Description: Datasheet
R23-R26 = CMP-26527-001021-1: 2.2kΩ ±1% 0.1W 0603 Thick Film Chip Resistor AEC-Q200 compliant; Resistance: 2.2kR; Temperature Coefficient: 100ppm/°C; Min Operating Temperature: -55°C; Mount: Surface Mount; Radiation Hardening: No; Case/Package: 0603; RoHS Compliant: Yes; Tolerance: 1%; Contact Plating: Tin; Max Operating Temperature: 155°C; Packaging: Tape and Reel; Resistor Type: Thick Film
R27 = CMP-03412-024106-2: RES 10KΩ 0.50% 0.1W 0603; RoHS Compliant: Yes
U13 = CMP-144040-000008-1: SENSOR HUMIDITY 100 RH SMD
U14 = CMP-144026-000007-1: CO2 SENSOR 40 PPM I2C SMD
U15 = CMP-2000-05073-3: SENSOR PRESSURE HUMIDITY TEMP; Sensor Type: Temperature; Accuracy: 3%; Response Time: 1s; Output Type: SPI; Min Operating Temperature: -40°C; Max Operating Temperature: 85°C; Case/Package: LGA; Packaging: Cut Tape; Mount: Surface Mount; Lead Free: Lead Free; Number of Pins: 8
U16 = CMP-02530-000005-1: SENSOR OPT 545NM AMBIENT 4SMD; Manufacturer: Vishay; Sensor Output: I2C; Max Supply Voltage: 3.6V; Operating Supply Current: 2-45uA; Min Supply Voltage: 2.5V; Max Junction Temp: +100°C; Height: 3.15mm; Category: IC; Automotive: No; Ambient Temperature Range Low: -25°C; Octopart: https://octopart.com/veml7700-tr-vishay-70519713; Ambient Temperature Range High: +85°C; Lead Free: Yes; Manufacturer Part Number: VEML7700-TR; Device Class L3: unset; Temperature Range High: +100°C; ComponentLink2URL: http://www.vishay.com/docs/84286/veml7700.pdf; Package: 6.550-5300.02-4; Digikey Description: SENSOR OPT 545NM AMBIENT 4SMD; Device Class L2: Optical Sensors; RoHS: TRUE; Temperature: to +100°C; ComponentLink2Description: Datasheet; Device Class L1: Sensors
U17 = CMP-22823-000001-1: CCS811B-JOPR5K LGA10 LF T&R; Operating Supply Current: 26mA; Min Operating Temperature: -5°C; Max Operating Temperature: 50°C
U18 = CMP-12177-000010-1: INEMO INERTIAL MODULE: 3D ACCELE; Manufacturer: STMicroelectronics; Sensor Type: Temperature,Accelerometer,Gyroscope; Accel Range: 2/4/8/16g; Accel Sensitivity: 0.061/0.122/0.244/0.488mV/g; Operating Supply Current: 0.55mA; Gyro Range: 125/250/500/1000/2000°/s; Gyro Sensitivity: 4.375/8.75/17.5/35/70LSB/°/s; Sensor Output: I2C,SPI,Other; Min Supply Voltage: 1.62V; Max Supply Voltage: 3.6V; Octopart: https://octopart.com/lsm6dsoxtr-stmicroelectronics-98102600; Package: LGA-14L-DM00249496; Footprint Url: https://www.st.com/content/ccc/resource/technical/document/technical_note/73/17/9c/16/dd/96/4a/01/CD00134799.pdf/files/CD00134799.pdf/jcr:content/translations/en.CD00134799.pdf; ComponentLink2Description: Datasheet; Mouser Description: LSM6DSOX: 3.6 V 3 Axis Accelerometer Gyroscope iNEMO Inertial Module - LGA-14L; ComponentLink2URL: https://www.st.com/resource/en/datasheet/lsm6dsox.pdf; Temperature Range Low: -40°C; Digikey Description: INEMO INERTIAL MODULE: 3D ACCELE; Lead Free: Yes; Device Class L3: Inertial Measurement Units (IMUs); Category: IC; Device Class L2: Motion Sensors; RoHS: TRUE; Temperature: -40°C to +85°C; Height: 0.86mm; Device Class L1: Sensors; Temperature Range High: +85°C; Manufacturer Part Number: LSM6DSOXTR; Automotive: No

## Sheet Variklis.SchDoc
size A4; SheetNumber: 5; SheetTotal: 6
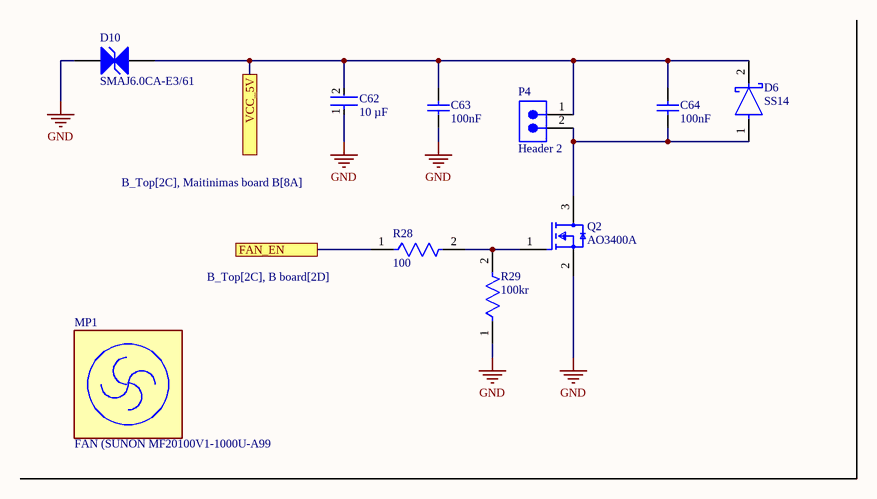
[diagram p5: Variklis.SchDoc]

### Parts
C62  10 µF  [FP-GQM219-0_15-IPC_B]
C63  100nF  [CAPC1608X92X38ML15T08]
C64  100nF  [CAPC1608X92X38ML15T08]
D6  SS14  [FP-403AE-MFG]
D10  SMAJ6.0CA-E3/61  [VISH-DO-214AC-2_L]
MP1  FAN (SUNON MF20100V1-1000U-A99  [FP-CFM-6015V-154-362-MFG]
P4  Header 2  [SMTC-TSW-102-22-X-S-RA]
Q2  AO3400A  [FP-SOT23-MFG]
R28  100  [FP-MCT0603-MFG]
R29  100kr  [FP-MCT0603-IPC_C]

### Ports
FAN_EN (see B_Top[2C], B board[2D]), VCC_5V (see B_Top[2C], Maitinimas board B[8A])

### Nets
GND: C62.1 C63.1 D10.1(A1) Q2.2(S) R29.1
VCC_5V: C62.2 C63.2 C64.2 D6.2(C) D10.2(A2) P4.1 ; port VCC_5V
NetC64_1: C64.1 D6.1(A) P4.2 Q2.3(D)
NetQ2_1: Q2.1(G) R28.2 R29.2
NetR28_1: R28.1 ; port FAN_EN

### Library data of the parts
C62 = CMP-06035-028339-1: Ceramic Capacitor 91pF ±1% 250VDC C0G 0805 Paper T/R
C63 C64 = CMP-2006-01140-1: Part Number: VJ0603Y104MXXAC; Manufacturer: Vitramon
D6 = CMP-2000-04943-2: DIODE SCHOTTKY 40V 1A SMA; Manufacturer: ON Semiconductor; Peak Reverse Current: 0.2mA; Max Junction Temp: +125°C; Standoff Height: 0.05mm; Max Surge Forward Current: 40A; Mouser Description: Schottky Diodes & Rectifiers SMA 40V 1.0A; RoHS: TRUE; Lead Free: Yes; Manufacturer Part Number: SS14; Device Class L3: Schottky Diodes; Category: Diode; Automotive: No; Digikey Description: DIODE SCHOTTKY 40V 1A SMA; ComponentLink2Description: Datasheet; Device Class L2: Diodes; Height: 2.5mm; Temperature Range High: +125°C; ComponentLink2URL: https://www.onsemi.com/pub/Collateral/SS19-D.PDF; Device Class L1: Discrete Semiconductors; Package: 403AE; Octopart: https://octopart.com/ss14-on+semiconductor-29205033; Max Repetitive Reverse Voltage: 40V; Temperature Range Low: -65°C; Forward Current: 1A; Temperature: -65°C to +125°C
D10 = CMP-0548-00193-2: Transient Voltage Suppressor, 6.40 to 231 V, 6 V Stand-off Voltage, Bi-Directional, -55 to 155 degC, 2-pin DO-214AC, Pb-Free, Tape and Reel; Manufacturer: Vishay Semiconductor; VWM (V): 6; IFSM: 40 A; VBR Bi-Directional (V): 6.4 to 231; ID (uA): 1600; PPPM (W): 400, 300; ComponentLink1URL: http://www.vishay.com/; ComponentLink1Description: Manufacturer URL; Packing: Tape and Reel; PackageReference: DO-214AC-2; ComponentLink2URL: http://www.vishay.com/docs/88390/smaj50a.pdf; RoHS: TRUE; Operating Junction and Storage Temperature Range: -55 to 150 degC; Mounting Technology: Surface Mount; PackageDescription: 2-Pin DO-214AC (SMA), Body 4.245 x 2.665 mm; ComponentLink3URL: http://www.vishay.com/docs/88390/smaj50a.pdf; PartNumber: SMAJ6.0CA-E3/61; DatasheetVersion: 12/8/2013; ComponentLink3Description: Package Specification; ComponentLink2Description: Datasheet
MP1 = CMP-12637-106233381-1: CFM-6015V-154-362 DC Fan Axial omniCOOL Bearing 12V 4.5V to 13.8V 30.4CFM 36.2dB 60 X 60 X 15mm; Max Input Current: 213mA; RoHS: Non-Compliant; Airflow: 30.4CFM; Lifecycle Status: Production; Length: 60mm; Schedule B: 8414599080; Max Operating Temperature: 70°C; NexarPartId: 106233381; Width: 60mm; Voltage Rating: 12V; Height: 15mm; Min Operating Temperature: -10°C
P4 = CMP-1024-00324-1: 0.025" SQ Post Header, Through-hole, Right Angle, -55 to 105 degC, 2.54 mm Pitch, 2-Pin, Male, RoHS; PartNumber: TSW-102-22-T-S-RA; Manufacturer: Samtec; Pitch: 2.54 mm; RoHS: True; ComponentLink1URL: http://www.samtec.com; Temperature Range: -55 to 105 degC; DatasheetVersion: F-214; ComponentLink3Description: Package Specification; ComponentLink2URL: http://www.samtec.com/documents/webfiles/pdf/TSW_TH.PDF; ComponentLink3URL: http://www.samtec.com/documents/webfiles/cpdf/TSW-XXX-XX-XXX-X-XX-XXX-MKT.pdf; ComponentLink1Description: Manufacturer URL; PackageVersion: DM, 8/1988; PackageDescription: .025[0.64] SQ. Post Terminal Strip Assembly; ComponentLink2Description: Datasheet; Mounting Technology: Through-hole; Orientation: Right Angle; PackageReference: TSW-102-22-X-S-RA
Q2 = CMP-83955-000006-1: as Q3 on sheet Maitinimas board B; Min Operating Temperature: -55°C; Lead Free: Lead Free; Number of Pins: 3; Drain to Source Voltage (Vdss): 30V; Case/Package: SOT-23; Mount: Surface Mount; Continuous Drain Current (ID): 5.7A; Radiation Hardening: No; Packaging: Tape and Reel; Max Operating Temperature: 150°C; Power Dissipation: 1.4W
R28 = CMP-02407-008087-1: RES SMD 100 OHM 1% 1/8W 0603; Power Rating: 125mW; Voltage Rating: 75V; Resistance: 100R; Max Operating Temperature: 175°C; Case Code (Imperial): 0603; Height: 0.45mm; Packaging: Tape and Reel; Min Operating Temperature: -55°C; Termination: SMD/SMT; Case/Package: 0603; Case Code (Metric): 1608; Width: 0.85mm; Length: 1.55mm; Tolerance: 1%; Composition: Thin Film; Weight: 6.7E-05oz
R29 = CMP-02407-008119-1: RES SMD 100 OHM 1% 1/8W 0603; Voltage Rating: 75V; Power Rating: 125mW; Length: 1.55mm; Packaging: Tape and Reel; Width: 0.85mm; Case Code (Metric): 1608; Weight: 6.7E-05oz; Tolerance: 1%; Height: 0.45mm; Resistance: 100kR; Case Code (Imperial): 0603; Max Operating Temperature: 175°C; Case/Package: 0603; Min Operating Temperature: -55°C; Composition: Thin Film

## Nets that join several sheets
GND: B board (60 pins), Maitinimas board B (49 pins), Komunikacija (7 pins), Sensors (26 pins), Variklis (5 pins)
VCC_3.3V: B board (26 pins), Maitinimas board B (9 pins), Komunikacija (C65.2 IC5.5 U19.3), Sensors (26 pins)
NetC17_2: B board (C17.2 R6.2 R7.1), Maitinimas board B (TP4.1)
NetIC1_4: B board (U4.45), Maitinimas board B (IC1.4)
NetIC1_6: B board (U4.46), Maitinimas board B (IC1.6)
NetIC2_2: B board (U4.8), Sensors (IC2.2 R27.2)
NetIC5_4: B board (U4.17), Komunikacija (IC5.4)
NetIC5_6: B board (U4.14), Komunikacija (IC5.6)
NetR28_1: B board (U4.24), Variklis (R28.1)
NetU4_35: B board (U4.35), Komunikacija (U19.1)
NetU4_58: B board (U4.58), Komunikacija (U19.4)
SCL1: B board (U4.51), Sensors (6 pins)
SCL2: B board (U4.43), Sensors (R23.1 U14.9 U17.10 U18.13)
SDA1: B board (U4.60), Sensors (6 pins)
SDA2: B board (U4.42), Sensors (R24.2 U14.10 U17.9 U18.14)
VBAT_PROT: B board (R2.2), Maitinimas board B (9 pins)
VCC_5V: Maitinimas board B (5 pins), Variklis (6 pins)